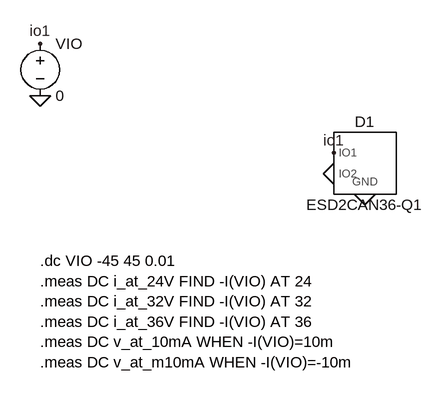
[diagram p0: schematic Model_test_ESD2CAN36.asc]
Model_test_ESD2CAN36.asc, the LTspice schematic file:
Version 4
SHEET 1 1400 700
SYMBOL ESD2CAN36-Q1 600 300 R0
SYMATTR InstName D1
FLAG 552 284 io1
FLAG 552 316 0
FLAG 600 348 0
SYMBOL voltage 100 100 R0
SYMATTR InstName VIO
SYMATTR Value 0
FLAG 100 116 io1
FLAG 100 196 0
TEXT 100 450 Left 2 !.dc VIO -45 45 0.01\n.meas DC i_at_24V FIND -I(VIO) AT 24\n.meas DC i_at_32V FIND -I(VIO) AT 32\n.meas DC i_at_36V FIND -I(VIO) AT 36\n.meas DC v_at_10mA WHEN -I(VIO)=10m\n.meas DC v_at_m10mA WHEN -I(VIO)=-10m

The netlist it stands for:
* Model_test_ESD2CAN36.asc
XD1 io1 0 0 ESD2CAN36-Q1  ; pins IO1 IO2 GND
VIO io1 0 0
.dc VIO -45 45 0.01
.meas DC i_at_24V FIND -I(VIO) AT 24
.meas DC i_at_32V FIND -I(VIO) AT 32
.meas DC i_at_36V FIND -I(VIO) AT 36
.meas DC v_at_10mA WHEN -I(VIO)=10m
.meas DC v_at_m10mA WHEN -I(VIO)=-10m
.lib C:\Users\polus\OneDrive\Pulpit\Projekty\Oscyloskop\Symulacje\ESD2CAN36-Q1.lib
.backanno
.end